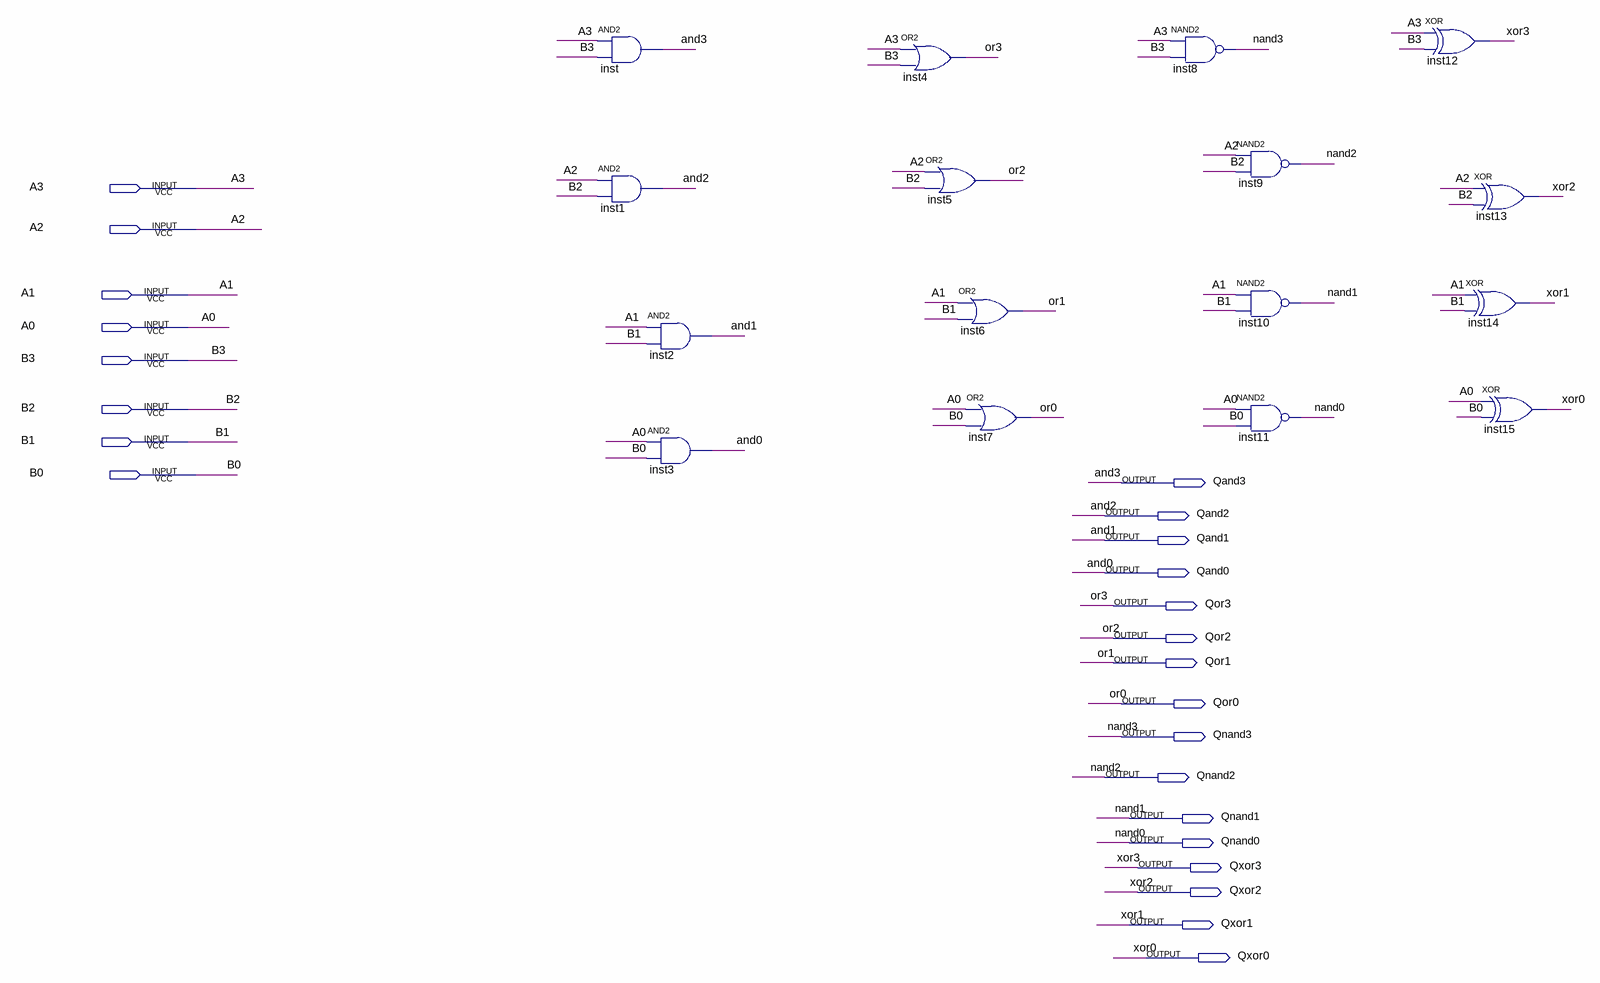
[diagram p0: schematic sheet]
// Quartus schematic logic.bdf as structural Verilog: 16 symbols, 24 pins
module \logic  (
  input  A3,
  input  A2,
  input  A1,
  input  A0,
  input  B3,
  input  B2,
  input  B1,
  input  B0,
  output Qand3,
  output Qand2,
  output Qand1,
  output Qand0,
  output Qor3,
  output Qor2,
  output Qor1,
  output Qor0,
  output Qnand3,
  output Qnand2,
  output Qnand1,
  output Qnand0,
  output Qxor3,
  output Qxor2,
  output Qxor1,
  output Qxor0
);

  and inst (Qand3, A3, B3);
  and inst1 (Qand2, A2, B2);
  and inst2 (Qand1, A1, B1);
  and inst3 (Qand0, A0, B0);
  or inst4 (Qor3, A3, B3);
  or inst5 (Qor2, A2, B2);
  or inst6 (Qor1, A1, B1);
  or inst7 (Qor0, A0, B0);
  nand inst8 (Qnand3, A3, B3);
  nand inst9 (Qnand2, A2, B2);
  nand inst10 (Qnand1, A1, B1);
  nand inst11 (Qnand0, A0, B0);
  xor inst12 (Qxor3, A3, B3);
  xor inst13 (Qxor2, A2, B2);
  xor inst14 (Qxor1, A1, B1);
  xor inst15 (Qxor0, A0, B0);

  // Other names for the same wires on the sheet: and0 = Qand0; and1 = Qand1; and2 = Qand2; and3 = Qand3;
  //   nand0 = Qnand0; nand1 = Qnand1; nand2 = Qnand2; nand3 = Qnand3; or0 = Qor0; or1 = Qor1; or2 = Qor2; or3 = Qor3;
  //   xor0 = Qxor0; xor1 = Qxor1; xor2 = Qxor2; xor3 = Qxor3
endmodule
